# EasyEDA Pro project ProPrj_power-board_2026-10-28.epro

# Schematic Schematic1
Board Name: Board1; Create Date: 2026-01-27; Page Name: P1; Project Name: 供电板; Schematic Name: Schematic1; Update Date: 2026-02-25; BladeWidth: 10; Company: 嘉立创EDA; Page Size: A4; RegionStart: 1; ShowBorder: 1; TitleBlock: 1; TitleBlockPosition: 3; Version: V1.0; XRegionCount: 6; YRegionCount: 4
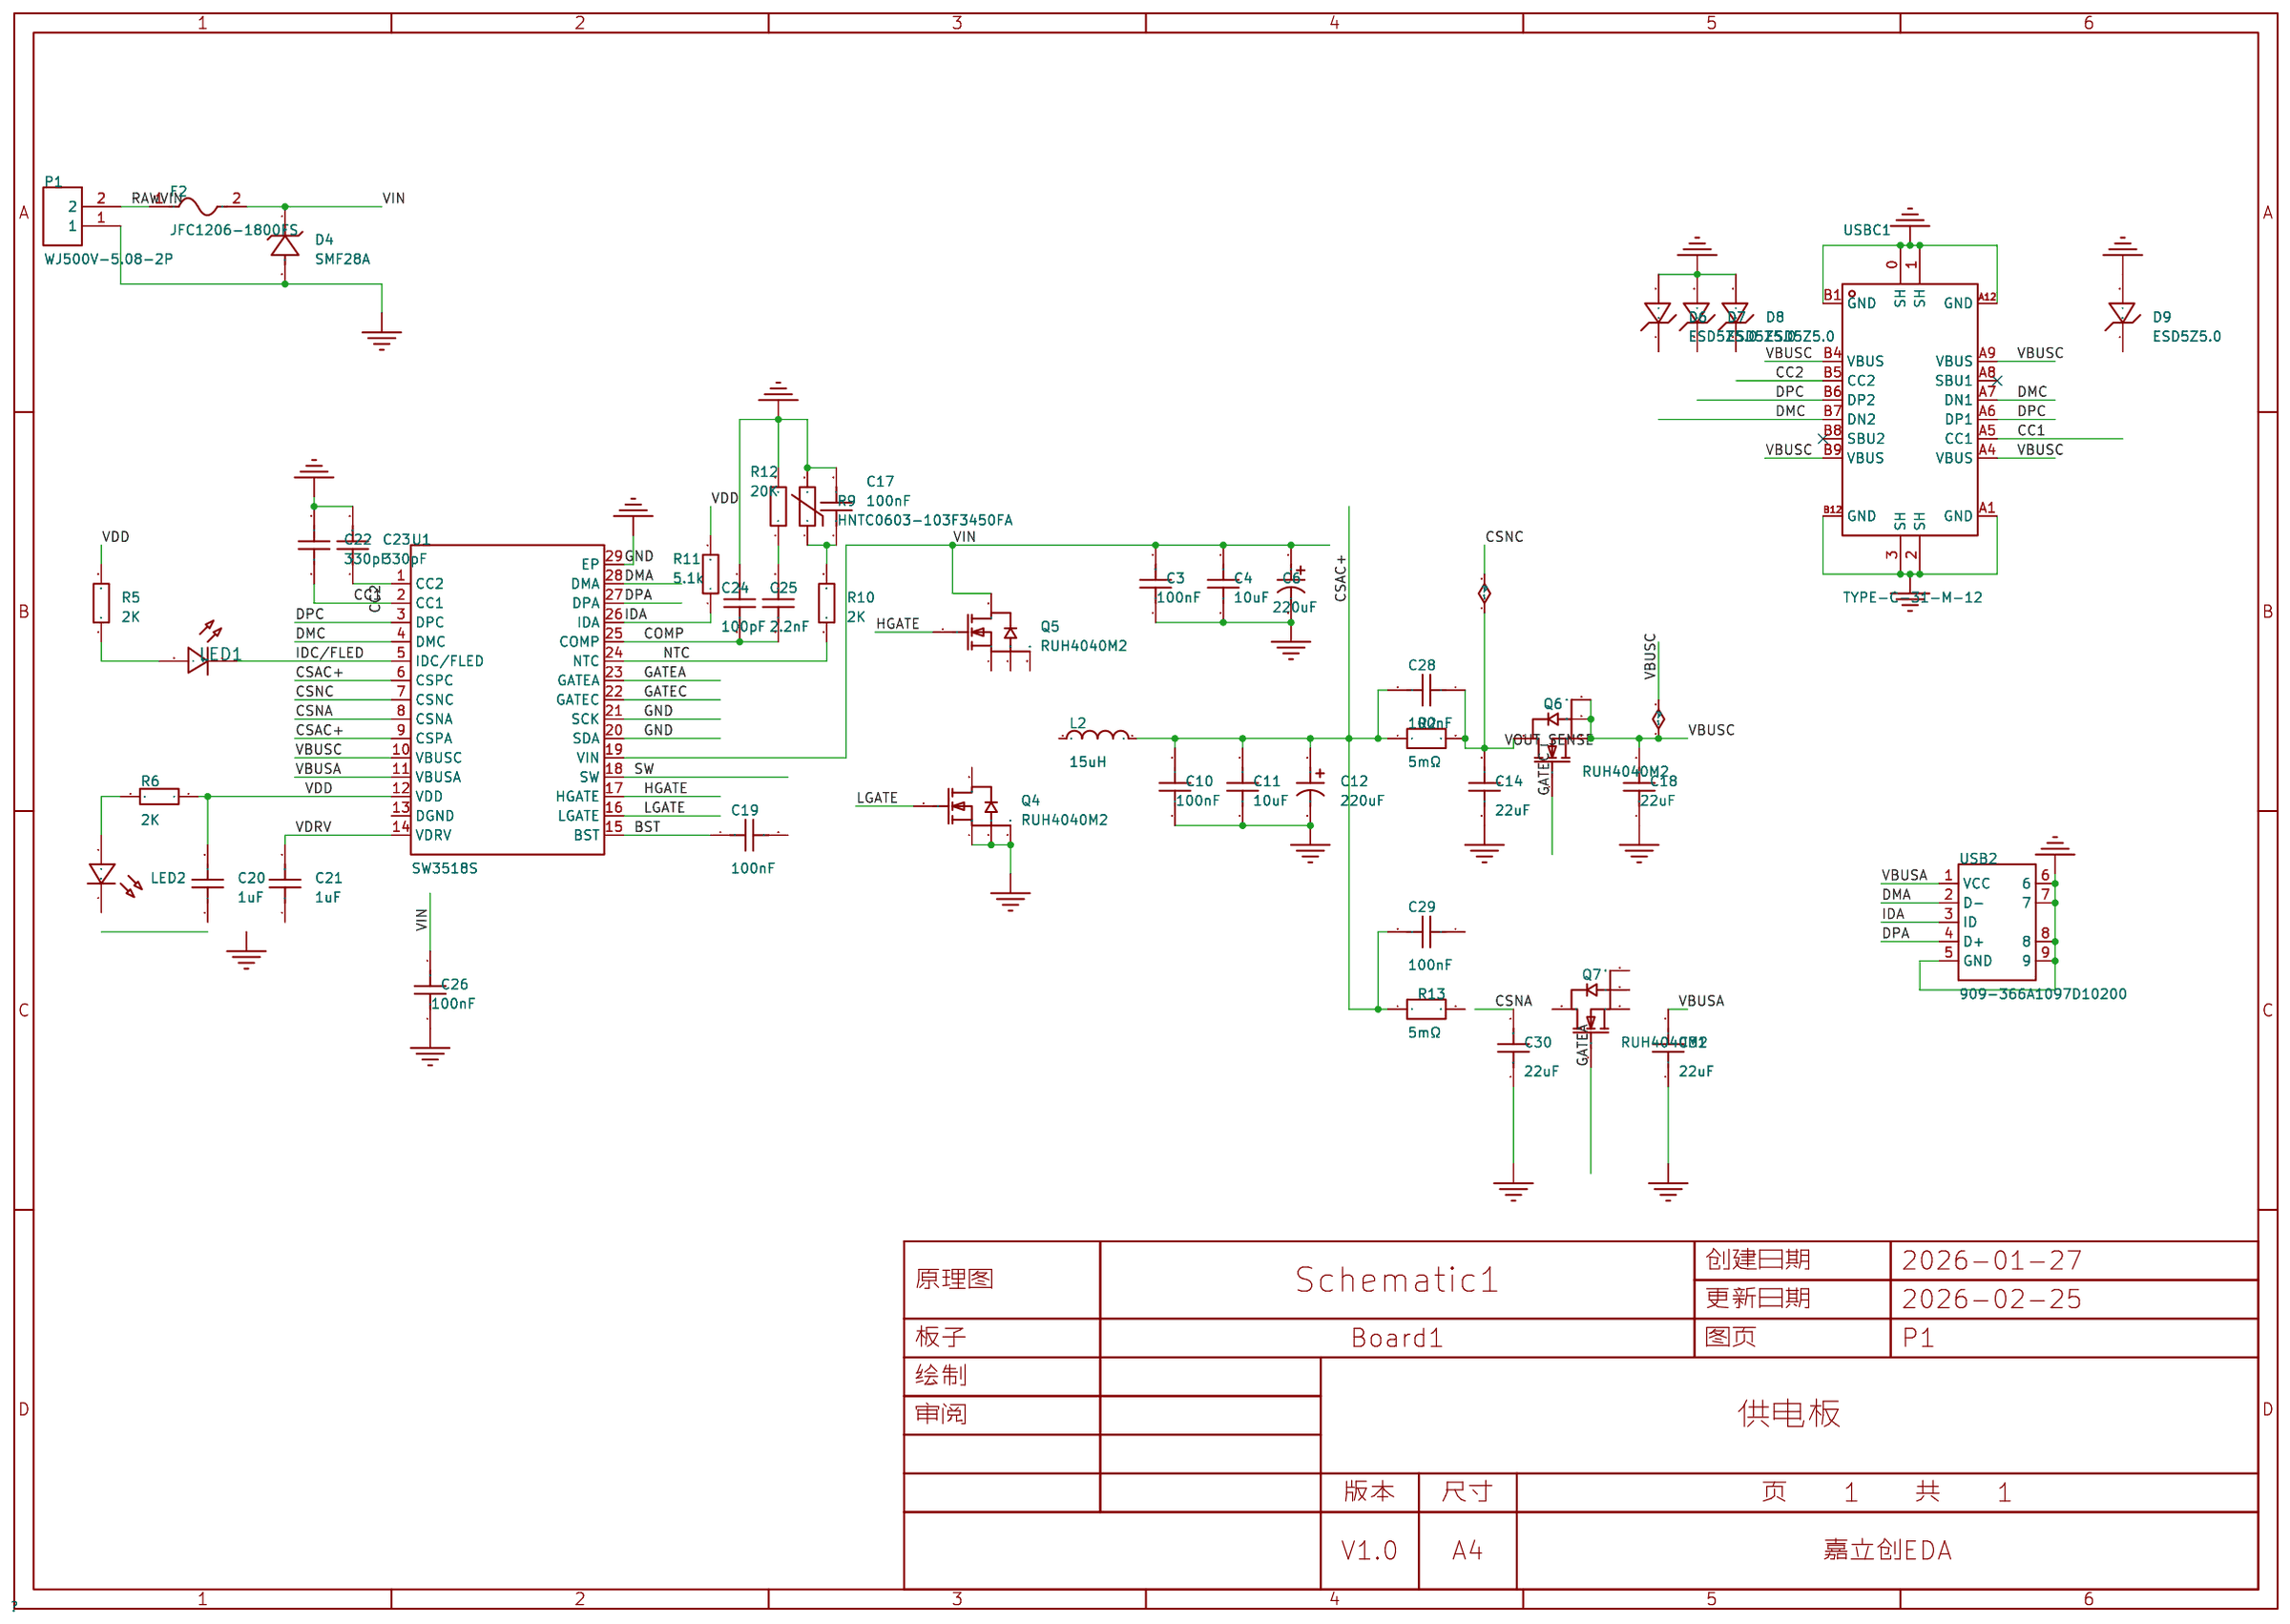
[diagram p0: schematic sheet]

## Parts
C3  100nF  [C0603]
C4  10uF  [C0603]
C6  220uF  [CAP-SMD_BD10.0-L10.3-W10.3-LS11.7-FD]
C10  100nF  [C0603]
C11  10uF  [C0603]
C12  220uF  [CAP-SMD_BD10.0-L10.3-W10.3-LS11.7-FD]
C14  22uF  [C0603]
C17  100nF  [C0603]
C18  22uF  [C0603]
C19  100nF  [C0402]
C20  1uF  [C0402]
C21  1uF  [C0402]
C22  330pF  [C0402]
C23  330pF  [C0402]
C24  100pF  [C0402]
C25  2.2nF  [C0402]
C26  100nF  [C0603]
C28  100nF  [C0603]
C29  100nF  [C0603]
C30  22uF  [C0603]
C31  22uF  [C0603]
D4  SMF28A  [SOD-123FL_L2.7-W1.8-LS3.8-RD]
D6  ESD5Z5.0  [SOD-523_L1.2-W0.8-LS1.6-RD]
D7  ESD5Z5.0  [SOD-523_L1.2-W0.8-LS1.6-RD]
D8  ESD5Z5.0  [SOD-523_L1.2-W0.8-LS1.6-RD]
D9  ESD5Z5.0  [SOD-523_L1.2-W0.8-LS1.6-RD]
F2  JFC1206-1800FS  [F1206]
L2  15uH  [IND-SMD_L12.6-W13.5]
LED1  -  [LED_0603]
LED2  -  [LED_0603]
P1  WJ500V-5.08-2P  [CONN-TH_2P-P5.00_WJ500V-5.08-2P]
Q4  RUH4040M2  [DFN-8_L3.3-W3.3-P0.65-BL-2]
Q5  RUH4040M2  [DFN-8_L3.3-W3.3-P0.65-BL-2]
Q6  RUH4040M2  [DFN-8_L3.3-W3.3-P0.65-BL-2]
Q7  RUH4040M2  [DFN-8_L3.3-W3.3-P0.65-BL-2]
R2  5mΩ  [R2512]
R5  2K  [R0603]
R6  2K  [R0603]
R9  HNTC0603-103F3450FA  [R0603]
R10  2K  [R0603]
R11  5.1k  [R0402]
R12  20K  [R0402]
R13  5mΩ  [R2512]
U1  SW3518S  [QFN-28_L4.0-W4.0-P0.40-BL-EP]
USB2  909-366A1097D10200  [USB-A-TH_C168724]
USBC1  TYPE-C-31-M-12  [USB-C_SMD-TYPE-C-31-M-12]

## Library data of the parts
C3 C4 C10 C11 C14 C17 C18 C26 C28-C31 = CAP_0603: Supplier Footprint: 0603
C6 C12 = JVJ50V220M10x10: 容值:220uF;精度:±20%;额定电压:50V;纹波电流:220mA@120Hz;; LCSC Part Name: 220uF ±20% 50V; Supplier Part: C46550417; Manufacturer: JIERR(捷而瑞); Supplier Footprint: SMD,D10xL10.5mm; JLCPCB Part Class: 扩展库; Datasheet: https://item.szlcsc.com/datasheet/JVJ50V220M10x10/48680111.html; Supplier: LCSC; Tolerance: ±20%; Voltage Rating: 50V; Ripple Current: 220mA@120Hz; Diameter: 10mm; Height - Seated (Max): 10.5mm; Lifetime: 2000hrs@105℃; Operating Temperature: -55℃~+105℃
C19-C25 = CAP_0402: Supplier Footprint: 0402
D4 = SMF28A_C720061: 反向截止电压(Vrwm):28V;钳位电压:45.4V;峰值脉冲电流(Ipp):4.4A;峰值脉冲功率(Ppp):200W;击穿电压:31.1V;; Supplier Part: C720061; Manufacturer: Littelfuse(美国力特); Supplier Footprint: SOD-123FL; JLCPCB Part Class: 扩展库; Datasheet: https://item.szlcsc.com/datasheet/SMF28A/763183.html; Supplier: LCSC; Reverse Stand-Off Voltage (Vrwm): 28V; Clamping Voltage: 45.4V; Peak Pulse Current (Ipp): 4.4A; Peak Pulse Power Dissipation (Ppp): 200W; Voltage - Breakdown: 31.1V; Reverse Leakage Current (Ir): 1uA; Type: TVS
D6-D9 = ESD5Z5.0: 极性:单向;反向截止电压(Vrwm):5V;钳位电压:18.6V;峰值脉冲电流(Ipp):9.4A;峰值脉冲功率(Ppp):200W@8/20us;击穿电压:6.2V;; LCSC Part Name: 200W单向表面贴装ESD二极管; Supplier Part: C397782; Manufacturer: AnBon(安邦); Supplier Footprint: SOD-523; JLCPCB Part Class: 扩展库; Datasheet: https://item.szlcsc.com/datasheet/ESD5Z5.0/379305.html; Supplier: LCSC; Polarity: 单向; Reverse Stand-Off Voltage (Vrwm): 5V; Clamping Voltage: 18.6V; Peak Pulse Current (Ipp): 9.4A; Peak Pulse Power Dissipation (Ppp): 200W@8/20us; Voltage - Breakdown: 6.2V; Reverse Leakage Current (Ir): 1uA; Operating Temperature: -40℃~+125℃; level of protection: IEC 61000-4-4；IEC 61000-4-5；IEC 61000-4-2; Type: ESD; Junction Capacitance: 80pF
F2 = JFC1206-1800FS: 类型:贴片式保险丝;额定电流:8A;额定电压 (AC):32V;额定电压:32V;分断能力:150A;; LCSC Part Name: 8A 32V 贴片式保险丝 快断; Supplier Part: C136353; Manufacturer: JDTfuse(集电通); Supplier Footprint: 1206; JLCPCB Part Class: 扩展库; Datasheet: https://item.szlcsc.com/datasheet/JFC1206-1800FS/147668.html; Supplier: LCSC; Type: 贴片式保险丝; Current Rating: 8A; Voltage Rating (AC): 32V; Voltage Rating (DC): 32V; Operating Temperature: -55℃~+125℃; Melting I2t: 14; Interrupt Rating: 150A; Length: 3.2mm; Width: 1.6mm
L2 = FXL1350-150-M: 电感值:15uH;精度:±20%;额定电流:8A;饱和电流(Isat):10A;类型:一体成型电感;; LCSC Part Name: 15uH ±20% 10A; Supplier Part: C7471125; Manufacturer: cjiang(长江微电); Supplier Footprint: SMD,13.5x12.6mm; JLCPCB Part Class: 扩展库; Datasheet: https://item.szlcsc.com/datasheet/FXL1350-150-M/8524279.html; Supplier: LCSC; Tolerance: ±20%; Current Rating: 8A; Current - Saturation(Isat): 10A; DC Resistance(DCR): 30mΩ; Type: 一体成型电感
LED1 = LED_0603-R: Supplier Footprint: 0603
LED2 = LED_0603-G: Supplier Footprint: 0603
P1 = WJ500V-5.08-2P: 结构:1x2P;间距:5.08mm;颜色:绿色;安装方式:直插;额定电流:18A;额定电压:250V;排数:1;线规 - AWG:14~30;线规 - 平方毫米:2.5;每排PIN数:2;触头材质:-;触头镀层:-;工作温度范围:-40℃~+105℃;焊接温度(最大值):-;; LCSC Part Name: 1x2P 5.08mm 直插 排数:1 每排P数:2; Supplier Part: C8465; Manufacturer: KANGNEX(康奈克斯电气); Supplier Footprint: 插件,P=5.08mm; JLCPCB Part Class: 扩展库; Datasheet: https://atta.szlcsc.com/upload/public/pdf/source/20191225/C8465_02D34CE5B5B4A53DF5891601D97FA9F4.pdf; Supplier: LCSC; Structure: 1x2P; Pitch: 5.08mm; Color: 绿色; Mounting Style: 直插; Current Rating (Max): 18A; Voltage Rating (Max): 250V; Number of Pins: 2P; Number of Rows: 1; Wire Gauge - AWG: 14~30; Wire Gauge - mm2: 2.5; Number of PINs Per Row: 2; Operating Temperature Range: -40℃~+105℃; Screw Specification: M2.5
Q4-Q7 = RUH4040M2_C49021258: Supplier Part: C49021258; Manufacturer: JSMSEMI(杰盛微); Supplier Footprint: DFN-8L(3x3); JLCPCB Part Class: 扩展库; Datasheet: https://item.szlcsc.com/datasheet/RUH4040M2/51379781.html; Supplier: LCSC
R2 R13 = JER2512F3R005: 电阻类型:采样电阻；合金电阻;阻值:5mΩ;精度:±1%;功率:3W;温度系数:±50ppm/℃;; LCSC Part Name: 5mΩ 3W 2512 ±1%; Supplier Part: C46634460; Manufacturer: JIERR(捷而瑞); Supplier Footprint: 2512; JLCPCB Part Class: 扩展库; Datasheet: https://item.szlcsc.com/datasheet/JER2512F3R005/48788262.html; Supplier: LCSC; Type: 采样电阻；合金电阻; Tolerance: ±1%; Power(Watts): 3W; Temperature Coefficient: ±50ppm/℃
R5 R6 R10 = Res_0603: Supplier Footprint: 0603
R9 = HNTC0603-103F3450FA: 阻值:10kΩ;电阻精度:±1%;功率:100mW;B值精度:±1%;最大稳态电流(25℃):310uA;; Supplier Part: C49247665; Manufacturer: R+O(宏嘉诚); Supplier Footprint: 0603; JLCPCB Part Class: 扩展库; Datasheet: https://item.szlcsc.com/datasheet/HNTC0603-103F3450FA/51678318.html; Supplier: LCSC; Resistance @ 25℃: 10kΩ; Resistance Tolerance: ±1%; B Constant (25℃/85℃): 3450K; Power(Watts): 100mW; B Constant Tolerance: ±1%; Steady State Current (Max): 310uA; Operating Temperature: -40℃~+125℃; Dissipation Factor: 1mW/℃; Thermal Time Constant: 5s; Length: 1.6mm; Width: 0.8mm; Height: 0.8mm; Pitch: 0.3mm
R11 R12 = Res_0402: Supplier Footprint: 0402
U1 = SW3518S: Supplier Part: C406811; Supplier Footprint: QFN-28-EP(4x4); JLCPCB Part Class: 扩展库; Supplier: LCSC
USB2 = 909-366A1097D10200: 连接器类型:Type-A;协议标准:USB 2.0;公母:母;安装方式:弯插;触点数量:5P;端口数量:1;额定电流 - 电源:1A;; LCSC Part Name: Type-A 母 弯插; Supplier Part: C168724; Manufacturer: 精拓金; Supplier Footprint: 插件; JLCPCB Part Class: 扩展库; Datasheet: https://item.szlcsc.com/datasheet/909-366A1097D10200/180107.html; Supplier: LCSC; Connector Type: Type-A; Protocol Standard: USB 2.0; Gender: 母; Mounting Type: 弯插; Number of Contacts: 5P; Number of Ports: 1; Current Rating-Power: 1A; Voltage Rating: 30V; Length: 12.9mm; Detection color: 绿色
USBC1 = TYPE-C-31-M-12: 连接器类型:Type-C;标准:-;公母:母;安装方式:-;触点数量:16P;端口数量:1;额定电流 - 电源:5A;工作温度范围:-;; LCSC Part Name: Type-C 母; Supplier Part: C165948; Manufacturer: 韩国韩荣; Supplier Footprint: SMD; JLCPCB Part Class: 扩展库; Datasheet: https://atta.szlcsc.com/upload/public/pdf/source/20220525/466408E853115E789EDB0DDC29077C05.pdf; Supplier: LCSC; Connector Type: Type-C; Gender: 母; Number of Contacts: 16P; Number of Ports: 1; Current Rating - Power (Max): 5A

## Nets
GND: C3.1 C4.1 C6.2 C10.1 C11.1 C12.2 C14.1 C17.2 C18.1 C20.1 C21.1 C22.2 C23.2 C24.2 C26.1 C30.1 C31.1 D4.2(A) D6.2(A) D7.2(A) D8.2(A) D9.2(A) LED2.1(C) P1.1 Q4.1(S) Q4.2(S) Q4.3(S) R9.2 R12.2 U1.13(DGND) U1.20(SDA) U1.21(SCK) U1.29(EP) USB2.5(GND) USB2.6 USB2.7 USB2.8 USB2.9 USBC1.0(SH) USBC1.1(SH) USBC1.2(SH) USBC1.3(SH) USBC1.A1(GND) USBC1.A12(GND) USBC1.B1(GND) USBC1.B12(GND)
VBUSA: C31.2 Q7.1(S) Q7.2(S) Q7.3(S) U1.11(VBUSA) USB2.1(VCC)
VBUSC: C18.2 Q6.1(S) Q6.2(S) Q6.3(S) U1.10(VBUSC) USBC1.A4(VBUS) USBC1.A9(VBUS) USBC1.B4(VBUS) USBC1.B9(VBUS)
VDD: C20.2 R5.2 R6.1 R11.2 U1.12(VDD)
VIN: C3.2 C4.2 C6.1 C26.2 D4.1(C) F2.2 Q5.5(D) U1.19(VIN)
BST: C19.1 U1.15(BST)
CC1: C22.1 D9.1(C) U1.2(CC1) USBC1.A5(CC1)
CC2: C23.1 D8.1(C) U1.1(CC2) USBC1.B5(CC2)
COMP: C24.1 C25.1 U1.25(COMP)
CSAC+: C10.2 C11.2 C12.1 C28.2 C29.2 L2.2 R2.1 R13.1 U1.6(CSPC) U1.9(CSPA)
CSNA: C29.1 C30.2 Q7.5(D) R13.2 U1.8(CSNA)
CSNC: C14.2 C28.1 Q6.5(D) R2.2 U1.7(CSNC)
DMA: U1.28(DMA) USB2.2(D-)
DMC: D6.1(C) U1.4(DMC) USBC1.A7(DN1) USBC1.B7(DN2)
DPA: U1.27(DPA) USB2.4(D+)
DPC: D7.1(C) U1.3(DPC) USBC1.A6(DP1) USBC1.B6(DP2)
GATEA: Q7.4(G) U1.23(GATEA)
GATEC: Q6.4(G) U1.22(GATEC)
HGATE: Q5.4(G) U1.17(HGATE)
IDA: R11.1 U1.26(IDA) USB2.3(ID)
IDC/FLED: LED1.1(C) U1.5(IDC/FLED)
LGATE: Q4.4(G) U1.16(LGATE)
NTC: R10.1 U1.24(NTC)
RAWVIN: F2.1 P1.2
SW: C19.2 L2.1 Q4.5(D) Q5.1(S) Q5.2(S) Q5.3(S) U1.18(SW)
VDRV: C21.2 U1.14(VDRV)
$1N3854: C25.2 R12.1
$1N4015: C17.1 R9.1 R10.2
Net-(LED1-2): LED1.2(A) R5.1
Net-(LED2-2): LED2.2(A) R6.2

Not connected (* = marked no-connect by the designer): USBC1 A8(SBU1)* B8(SBU2)*

# Board PCB1
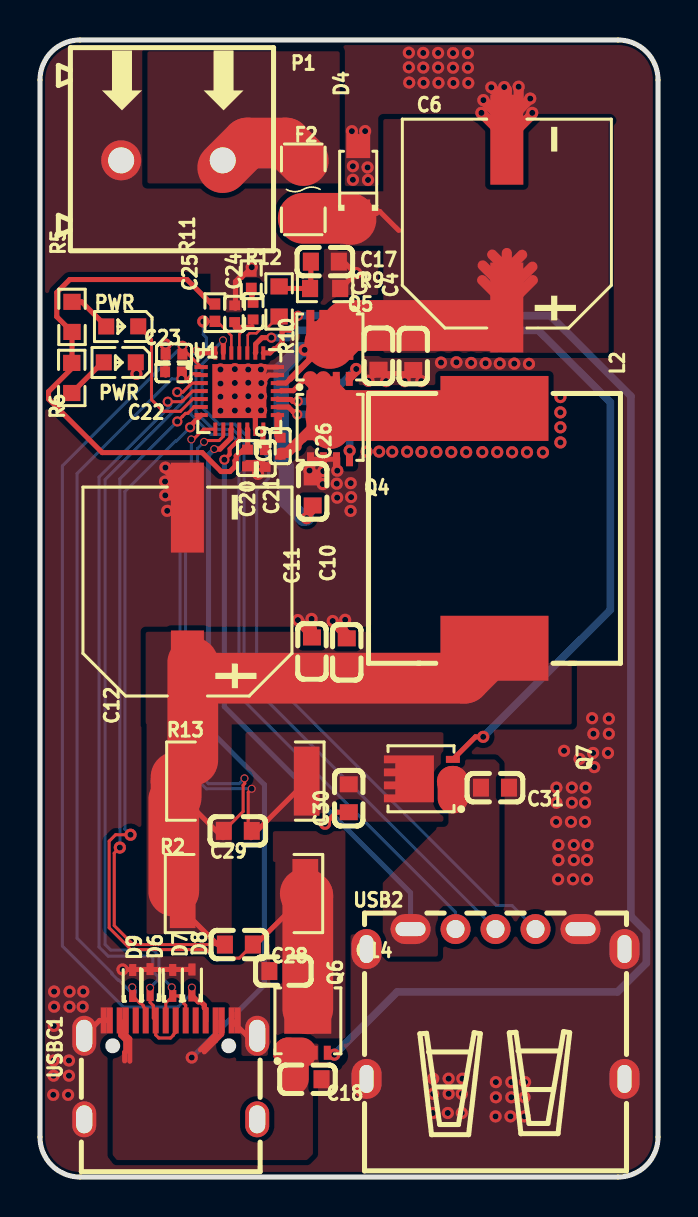
[diagram p1: board, top side]
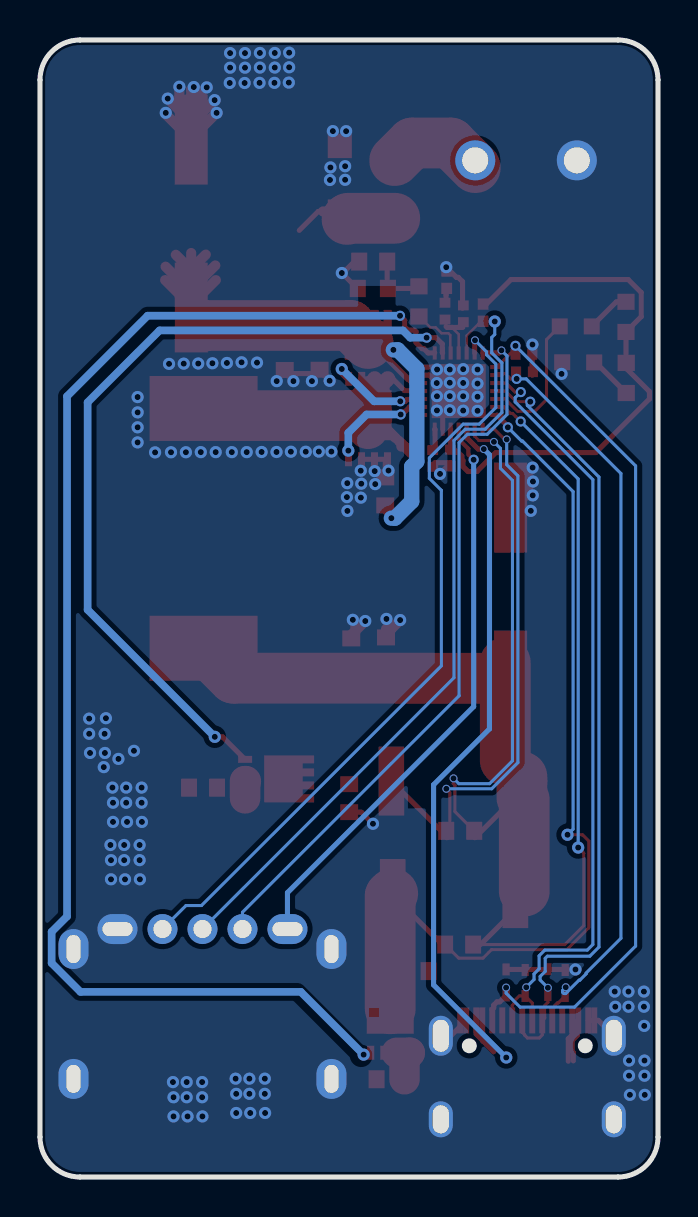
[diagram p2: board, bottom side, seen from below]

Outline 30.91 x 56.9 mm; copper layers: Top Layer, Inner1, Inner2, Bottom Layer. Coordinates in mm from the lower left corner of the outline.
Outline path: 0,54.9 0,2 arc(0.59,0.59) 2,0 28.91,0 arc(30.32,0.59) 30.91,2 30.91,54.9 arc(30.32,56.31) 28.91,56.9 2,56.9 arc(0.59,56.31) 0,54.9
Stack: Top Layer 0.035mm 外层铜厚1oz / Dielectric1 0.2104mm 7628 RC49% 8.6mil / Inner1 0.0152mm 内层铜厚 / Dielectric2 1.065mm 1.1mm H/HOZ Copper / Inner2 0.0152mm 内层铜厚 / Dielectric3 0.2104mm 7628 RC49% 8.6mil / Bottom Layer 0.035mm 外层铜厚1oz

## Design rules (mm)
net DPC: DP3
net DMC: DP3
spacing copperThickness1oz (default): track to track 0.102, other pairs 0.152 to 0.3
spacing copperThickness2oz: track to track 0.203, other pairs 0.152 to 0.3
spacing Plane_innerPlane: track to track 0.102, other pairs 0.152 to 0.3
spacing Copper_copperRegion: track to track 0.102, other pairs 0.152 to 0.3
track width copperThickness1oz (default): min 0.127, default 0.254, max 2.54
track width copperThickness2oz: min 0.203, default 0.254, max 2.54
differential pair differentialPair (default): width min 0.127, default 0.254, max 2.54; gap min 0.152, default 0.152
pour e674 uses Copper_copperRegion
pour e676 uses Copper_copperRegion
pour e678 uses Copper_copperRegion
pour e680 uses Copper_copperRegion
pour e682 uses Copper_copperRegion
pour e684 uses Copper_copperRegion
pour e686 uses Copper_copperRegion
pour e688 uses Copper_copperRegion
pour e690 uses Copper_copperRegion
pour e692 uses Copper_copperRegion
pour e694 uses Copper_copperRegion
pour e696 uses Copper_copperRegion
pour e701 uses Copper_copperRegion
pour e705 uses Copper_copperRegion

## Placement (name value [footprint] x y rotation side)
C3  100nF  [C0603]  16.93 41.1 90 top
C4  10uF  [C0603]  18.66 41.08 90 top
C6  220uF  [CAP-SMD_BD10.0-L10.3-W10.3-LS11.7-FD]  23.34 47.71 90 top
C10  100nF  [C0603]  15.34 26.25 270 top
C11  10uF  [C0603]  13.6 26.3 270 top
C12  220uF  [CAP-SMD_BD10.0-L10.3-W10.3-LS11.7-FD]  7.37 29.3 90 top
C14  22uF  [C0603]  12.17 10.31 0 top
C17  100nF  [C0603]  14.24 45.81 0 top
C18  22uF  [C0603]  13.38 4.89 180 top
C19  100nF  [C0402]  12.01 36.57 270 top
C20  1uF  [C0402]  10.38 35.98 90 top
C21  1uF  [C0402]  11.26 35.96 90 top
C22  330pF  [C0402]  6.68 40.29 180 top
C23  330pF  [C0402]  6.7 41.17 180 top
C24  100pF  [C0402]  9.73 43.2 90 top
C25  2.2nF  [C0402]  10.65 43.33 90 top
C26  100nF  [C0603]  13.64 34.31 270 top
C28  100nF  [C0603]  9.94 11.63 180 top
C29  100nF  [C0603]  9.89 17.32 180 top
C30  22uF  [C0603]  15.44 18.96 90 top
C31  22uF  [C0603]  22.75 19.48 180 top
D4  SMF28A  [SOD-123FL_L2.7-W1.8-LS3.8-RD]  15.91 49.95 90 top
D6  ESD5Z5.0  [SOD-523_L1.2-W0.8-LS1.6-RD]  5.51 9.75 90 top
D7  ESD5Z5.0  [SOD-523_L1.2-W0.8-LS1.6-RD]  6.64 9.71 90 top
D8  ESD5Z5.0  [SOD-523_L1.2-W0.8-LS1.6-RD]  7.6 9.74 90 top
D9  ESD5Z5.0  [SOD-523_L1.2-W0.8-LS1.6-RD]  4.64 9.71 90 top
F2  JFC1206-1800FS  [F1206]  13.17 49.42 270 top
L2  15uH  [IND-SMD_L12.6-W13.5]  22.73 32.46 270 top
P1  WJ500V-5.08-2P  [CONN-TH_2P-P5.00_WJ500V-5.08-2P]  6.6 50.87 0 top
PWR  -  [LED_0603]  4.06 42.56 180 top
PWR#2  -  [LED_0603]  3.94 40.76 180 top
Q4  RUH4040M2  [DFN-8_L3.3-W3.3-P0.65-BL-2]  14.5 36.68 0 top
Q5  RUH4040M2  [DFN-8_L3.3-W3.3-P0.65-BL-2]  14.49 40.7 0 top
Q6  RUH4040M2  [DFN-8_L3.3-W3.3-P0.65-BL-2]  13.39 6.98 0 top
Q7  RUH4040M2  [DFN-8_L3.3-W3.3-P0.65-BL-2]  19.88 19.92 90 top
R2  5mΩ  [R2512]  10.2 14.18 0 top
R5  2K  [R0603]  1.6 43.04 270 top
R6  2K  [R0603]  1.59 39.99 270 top
R9  HNTC0603-103F3450FA  [R0603]  14.26 44.46 0 top
R10  2K  [R0603]  11.96 43.81 90 top
R11  5.1k  [R0402]  8.75 43.25 90 top
R12  20K  [R0402]  10.57 44.9 90 top
R13  5mΩ  [R2512]  10.27 19.81 0 top
U1  SW3518S  [QFN-28_L4.0-W4.0-P0.40-BL-EP]  9.97 39.33 270 top
USB2  909-366A1097D10200  [USB-A-TH_C168724]  22.78 8.66 0 top
USBC1  TYPE-C-31-M-12  [USB-C_SMD-TYPE-C-31-M-12]  6.54 5.36 0 top

## Footprints (pads in the part's own frame, mm; a bottom-side part is the same pattern mirrored in y, then rotated)
C0402
  rect 0.5x0.54 smd: 1(-0.42,0) 2(0.42,0)
C0603
  rect 0.8x0.9 smd: 1(-0.7,0) 2(0.7,0)
CAP-SMD_BD10.0-L10.3-W10.3-LS11.7-FD
  rect 4.5x1.65 smd: 1(-4.2,0) 2(4.2,0)
CONN-TH_2P-P5.00_WJ500V-5.08-2P
  round 2 hole 1.3: 1(-2.54,0) 2(2.54,0)
DFN-8_L3.3-W3.3-P0.65-BL-2
  rect 0.35x0.7 smd: 1(-0.975,-0.765) 2(-0.325,-0.765) 3(0.325,-0.765) 4(0.975,-0.765)
  custom 2.352x2.498 smd: 5(0,0.765)
F1206
  rect 1.19x1.728 smd: 1(-1.445,0) 2(1.445,0)
IND-SMD_L12.6-W13.5
  rect 3.25x5.4 smd: 1(-6,0) 2(6,0)
LED_0603
  rect 0.8x0.8 smd: 1(-0.851,-0.01) 2(0.75,-0.005)
QFN-28_L4.0-W4.0-P0.40-BL-EP
  rect 0.2x0.665 smd: 1(-1.2,-1.907) 2(-0.8,-1.907) 3(-0.4,-1.907) 4(0,-1.907) 5(0.4,-1.907) 6(0.8,-1.907) 7(1.2,-1.907) 15(1.2,1.907) 16(0.8,1.907) 17(0.4,1.907) 18(0,1.907) 19(-0.4,1.907) 20(-0.8,1.907) 21(-1.2,1.907)
  rect 0.665x0.2 smd: 8(1.907,-1.2) 9(1.907,-0.8) 10(1.907,-0.4) 11(1.907,0) 12(1.907,0.4) 13(1.907,0.8) 14(1.907,1.2) 22(-1.907,1.2) 23(-1.907,0.8) 24(-1.907,0.4) 25(-1.907,0) 26(-1.907,-0.4) 27(-1.907,-0.8) 28(-1.907,-1.2)
  rect 2.7x2.7 smd: 29(0,0)
R0402
  rect 0.566x0.54 smd: 1(-0.433,0) 2(0.433,0)
R0603
  rect 0.806x0.864 smd: 1(-0.753,0) 2(0.753,0)
R2512
  rect 1.282x3.456 smd: 1(-3.067,0) 2(3.067,0)
SOD-123FL_L2.7-W1.8-LS3.8-RD
  rect 1.2x1.2 smd: 1(-1.635,0) 2(1.635,0)
SOD-523_L1.2-W0.8-LS1.6-RD
  rect 0.6x0.36 smd: 1(-0.65,0) 2(0.65,0)
USB-A-TH_C168724
  oval 2x1.5 hole 1.5x0.7: 1(-4.25,3.75) 5(4.25,3.75)
  round 1.5 hole 0.9: 2(-2,3.75) 3(0,3.75) 4(2,3.75)
  oval 1.5x2 hole 0.7x1.4: 6(-6.45,2.75) 7(-6.45,-3.75) 8(6.45,-3.75) 9(6.45,2.75)
USB-C_SMD-TYPE-C-31-M-12
  oval 1.2x2 hole 0.8x1.6: 0(-4.325,1.706) 1(4.325,1.706)
  oval 1.2x1.8 hole 0.8x1.4: 2(4.325,-2.474) 3(-4.325,-2.474)
  rect 0.3x1.3 smd: A1(-3.35,2.474) A4(-2.55,2.474) A5(-1.25,2.474) A6(-0.25,2.474) A7(0.25,2.474) A8(1.25,2.474) A9(2.55,2.474) A12(3.35,2.474) B1(3.05,2.474) B4(2.25,2.474) B5(1.75,2.474) B6(0.75,2.474) B7(-0.75,2.474) B8(-1.75,2.474) B9(-2.25,2.474) B12(-3.05,2.474)

## Nets
As in the schematic, except:
GND: C3.1 C4.1 C6.2 C10.1 C11.1 C12.2 C14.1 C17.2 C18.1 C20.1 C21.1 C22.2 C23.2 C24.2 C26.1 C30.1 C31.1 D4.2 D6.2 D7.2 D8.2 D9.2 P1.1 PWR#2.1 Q4.1 Q4.2 Q4.3 R9.2 R12.2 U1.13 U1.20 U1.21 U1.29 USB2.5 USB2.6 USB2.7 USB2.8 USB2.9 USBC1.0 USBC1.1 USBC1.2 USBC1.3 USBC1.A1 USBC1.A12 USBC1.B1 USBC1.B12
IDC/FLED: PWR.1 U1.5
$1N3327: PWR.2 R5.1
$1N3513: PWR#2.2 R6.2

Pads without a net: USBC1 A8 B8

## Via types
v1: diameter 0.61, hole 0.305, Top Layer to Bottom Layer, 164 vias
v2: diameter 0.399, hole 0.299, Top Layer to Bottom Layer, 11 vias
v3: diameter 0.508, hole 0.305, Top Layer to Bottom Layer, 11 vias

## Routing (per net, layer and track width the routed paths; a pad name or vN(x,y) marks a point on that pad's centre or on a via; arc(x,y) is an arc through that point)
GND: length 45.2
  Top Layer w0.254: D8.2 v1(4.13,10.39) ; 11.15,35.75 11.15,35.74 10.36,35.74 10.9,35.2 v1(10.9,35.18) ; v1(13.58,27.93) 13.6,27.91 C11.1 ; v1(19.07,39.83) 19.07,39.98 C4.1 18.66,40.29 ; v1(10.59,45.53) 10.08,45.02 9.98,45.02 9.77,44.81 9.77,43.47 ; v1(11.05,38.36) 10.77,38.07 U1.13 ; 15.26,27.2 v1(15.26,27.88) ; 2.21,7.07 2.98,7.84 USBC1.A1 USBC1.B12 ; U1.20 11.45,40.13 11.26,39.94 11.26,39.93 v1(11.06,39.73) ; USBC1.B1 10.35,7.07 USBC1.1 ; C26.1 13.64,35.81 Q4.1 Q4.2 Q4.3 ; 11.88,40.53 11.17,40.53 v1(11.05,40.41) ; 6.28,40.13 6.29,40.14 6.29,41.16 ; 14.94,46.05 15.76,45.24 v1(15.81,45.24) 15.04,44.46 R9.2 ; 18.66,40.29 18.57,40.2 17.12,40.2 17.31,40.02 v1(17.31,39.83) ; 18.66,40.29 18.66,40.26 v1(18.23,39.83) ; C30.1 14.83,18.26 v1(14.25,17.68) ; v1(16.42,39.84) 16.93,40.35 C3.1 ; 9.17,38.2 v1(9.03,38.34) ; v1(15.6,52.33) 15.91,52.02 D4.2 16.26,51.94 v1(16.26,52.34)
  Top Layer w0.508: v1(6.36,33.34) 7.22,33.34 7.64,33.75 7.64,34.13 v1(6.27,35.5) ; v1(22.17,53.89) 23.34,52.72 ; C6.2 24.62,53.18 v1(24.62,53.25) ; 13.6,27.42 13.34,27.42 v1(12.9,27.87) ; v1(22.57,54.53) 23.34,53.75 23.34,54.41 v1(23.22,54.54) ; v1(6.25,34.8) 6.95,34.11 v1(6.26,34.11) ; C10.1 15.34,27.12 15.26,27.2 v1(14.64,27.82) ; v1(23.94,54.56) 23.94,53.38 v1(24.52,53.96) ; v1(22.07,53.25) 23.34,51.98
  vias: v1(0.7,9.28) v1(0.7,8.52) v1(0.69,7.56) v1(0.68,5.83) v1(0.68,5.07) v1(0.66,4.11) v1(1.41,4.11) v1(1.48,9.28) v1(1.48,8.52) v1(1.45,5.83) v1(1.45,5.07) v1(2.14,8.52) v1(2.16,9.28) v1(4.82,40.19) v1(6.28,41.66) v1(9.03,40.41) v1(9.03,39.7) v1(9.03,39.04) v1(9.74,40.43) v1(9.74,39.73) v1(9.74,39.07) v1(9.74,38.35) v1(10.41,40.41) v1(10.41,39.75) v1(10.41,39.07) v1(10.41,38.37) v1(11.05,39.07) v1(13.48,35.35) v1(14.17,35.32) v1(14.14,34.67) v1(14.87,35.34) v1(14.84,34.69) v1(14.86,34) v1(15.53,33.33) v1(15.54,34.72) v1(15.56,34.02) v1(15.65,50.58) v1(15.65,49.9) v1(16.33,36.3) v1(16.38,50.52) v1(16.4,49.89) v1(16.96,36.3) v1(17.61,36.29) v1(18.36,36.29) v1(18.45,56.26) v1(18.45,55.53) v1(18.46,54.77) v1(19.08,36.28) v1(19.16,56.25) v1(19.16,55.52) v1(19.18,54.75) v1(19.66,4.92) v1(19.66,4.16) v1(19.65,3.2) v1(19.82,36.28) v1(19.91,56.25) v1(19.91,55.52) v1(19.93,54.75) v1(20.05,40.75) v1(20.44,4.92) v1(20.44,4.16) v1(20.39,3.2) v1(20.57,36.27) v1(20.65,56.24) v1(20.65,55.51) v1(20.67,54.75) v1(20.82,40.77) v1(21.12,4.92) v1(21.09,4.16) v1(21.09,3.2) v1(21.31,36.27) v1(21.4,56.24) v1(21.4,55.51) v1(21.42,54.75) v1(21.56,40.74) v1(22.12,36.27) v1(22.28,40.72) v1(22.8,4.75) v1(22.8,3.99) v1(22.78,3.03) v1(22.86,36.27) v1(22.99,40.71) v1(23.53,3.03) v1(23.61,36.27) v1(23.57,4.75) v1(23.57,3.99) v1(23.72,40.7) v1(24.23,3.99) v1(24.23,3.03) v1(24.26,4.75) v1(24.35,36.27) v1(24.45,40.69) v1(25.15,36.26) v1(25.82,19.49) v1(25.82,18.73) v1(25.81,17.77) v1(25.92,16.61) v1(25.92,15.86) v1(25.91,14.9) v1(26.02,39.03) v1(26.02,38.26) v1(26.02,37.52) v1(26.02,36.76) v1(26.21,21.33) v1(26.6,19.49) v1(26.6,18.73) v1(26.55,17.77) v1(26.7,16.61) v1(26.7,15.86) v1(26.65,14.9) v1(26.98,20.92) v1(27.28,19.49) v1(27.25,18.73) v1(27.25,17.77) v1(27.38,16.61) v1(27.35,15.86) v1(27.35,14.9) v1(27.61,22.96) v1(27.67,22.18) v1(27.66,21.22) v1(27.72,20.51) v1(28.4,21.22) v1(28.45,22.94) v1(28.45,22.18)
VBUSA: length 30.1
  Top Layer w0.203: U1.11 9.97,36.93 9.48,36.44 9.48,36.16 v3(9.22,35.89)
  Top Layer w1.524: Q7.1 Q7.2 20.65,19.81 20.61,19.81
  Bottom Layer w0.254: v3(9.22,35.89) 9.22,23.54 18.53,14.23 USB2.1
VBUSC: length 44.8
  Top Layer w0.254: USBC1.B9 4.29,7.12 4.49,6.92 4.49,5.8 ; USBC1.B4 8.79,7.13 8.02,6.37 ; USBC1.A9 9.09,7.14 8.78,6.84 8.78,6.83 8.22,6.26 ; USBC1.A4 4.04,7.79 4.04,7.09 4.29,6.84 4.29,6.3 4.23,6.24 4.23,5.81 ; v2(8.71,36.43) 9,36.43 9.55,36.97 9.55,37.4 U1.10
  Top Layer w1.524: C18.2 12.68,5.96 Q6.1 Q6.2
  Bottom Layer w0.254: v1(7.59,5.98) 11.22,9.61 11.22,19.63 8.43,22.42 8.43,36.14 v2(8.71,36.43)
VDD: length 27.9
  Top Layer w0.254: R11.2 8.58,43.68 7.35,44.91 1.49,44.91 0.84,44.26 0.84,43.05 R5.2 1.6,40.75 R6.1 1.59,40.46 0.43,39.3 0.43,38.94 3.11,36.25 8.11,36.25 9.06,35.3 9.5,35.3 9.75,35.56 9.75,35.84 9.81,35.9 9.81,36.09 9.98,36.25 10.03,36.25 10.39,36.61 10.39,37.4 U1.12
VIN: length 38.7
  Top Layer w0.254: 13.87,33.37 C26.2 13.64,33.27 v1(13.34,32.97) ; 16.16,48.32 16.99,48.32 17.94,47.37 ; 11.88,39.73 12.3,39.73 12.51,39.94 ; 14.04,41.47 Q5.5
  Top Layer w0.305: 12.51,39.94 14.04,41.47
  Top Layer w0.508: 24.11,46.15 23.37,45.41 ; C6.1 23.34,43.65 22.11,44.88 ; 22.14,45.61 23.34,44.41 23.34,45.43 ; 23.34,45.43 23.34,46.24 ; 23.34,45.43 22.61,46.16 ; 15.93,48.32 16.75,48.32 ; 24.62,45.55 23.37,44.3 ; 24.65,44.88 23.72,43.95
  Top Layer w2.54: 14.49,41.71 15.39,42.61 22.7,42.61 22.74,42.57 ; F2.2 15.49,47.97 ; 15.53,47.94 15.55,47.92
  Bottom Layer w0.762: v1(13.23,41.39) 13.01,41.39 12.06,40.44 12.06,35.81 12.32,35.55 12.32,33.81 13.15,32.97 v1(13.34,32.97)
BST: length 1.1
  Top Layer w0.254: 11.93,38.07 U1.15
  Top Layer w0.381: 11.93,37.1 11.91,37.12 11.91,38.06 11.93,38.07
CC1: length 37.9
  Top Layer w0.152: D9.1 4.98,8.71 5.03,8.71 5.17,8.58 5.17,8.53 5.29,8.41 USBC1.A5 ; U1.2 7.99,40.2 7.63,40.2 7.37,39.94 v3(7.07,39.94)
  Top Layer w0.254: v3(7.07,39.94) 7.1,39.97 C22.1
  Bottom Layer w0.152: v2(4.61,9.5) 4.77,9.34 4.77,9.25 4.71,9.18 4.62,9.18 3.95,9.85 3.91,9.85 3.59,10.16 3.59,10.21 1.85,11.94 1.85,35.2 6.59,39.94 v3(7.07,39.94)
CC2: length 44.1
  Top Layer w0.152: 7.13,41.46 8.06,40.53
  Top Layer w0.254: USBC1.B5 8.29,8.4 8.22,8.47 8.22,8.6 8.05,8.77 7.92,8.77 D8.1 ; 7.13,41.16 7.13,41.16 7.13,41.46
  Bottom Layer w0.152: v2(7.6,9.48) 7.6,9.2 6.9,8.5 4.17,8.5 1.12,11.56 1.12,35.59 v3(7.13,41.59)
COMP: length 2.3
  Top Layer w0.127: 10.31,42.51 9.97,42.17 U1.25
  Top Layer w0.254: 10.6,42.56 10.55,42.51 9.76,42.51
CSAC+: length 89.7
  Top Layer w0.152: C29.2 10.16,18.29 10.16,19.61 10.24,19.69 10.24,19.94 v2(10.23,19.95) ; v2(8.2,36.79) 8.27,36.85 8.96,36.85 9.17,37.06 U1.9 ; 8.06,38.53 7.99,38.53 arc(8.1,38.53) 8.21,38.51 8.21,38.55 7.73,38.55 arc(7.71,38.55) 7.69,38.55 7.69,38.52 7.39,38.21 7.28,38.21 7.13,38.06 7.12,38.06 v3(6.87,37.81) ; C28.2 4.66,11.63 3.71,12.58 3.71,16.21 v1(3.99,16.49)
  Top Layer w0.254: 9.15,16.98 7.2,18.93 ; 8.87,11.63 7.13,13.37
  Top Layer w2.54: 6.81,18.99 6.81,20.02 ; 8.16,24.96 21.23,24.96 L2.2 ; 6.69,18.87 6.69,14.31 ; 7.64,25.74 7.64,20.85
  Bottom Layer w0.152: v1(3.99,16.49) 3.99,34.93 v3(6.87,37.81) ; v2(8.2,36.79) 7.88,36.46 7.88,35.46 7.28,34.86 7.28,20.83 8.42,19.68 9.96,19.68 v2(10.23,19.95)
CSNA: length 28.2
  Top Layer w0.152: v2(7.57,36.91) 7.67,36.91 8.18,37.42 U1.8 ; C29.1 10.41,17.5 10.41,19.25 v2(10.59,19.43)
  Top Layer w0.254: R13.2 10.55,17.03 10.55,16.98
  Bottom Layer w0.152: v2(10.59,19.43) 8.32,19.43 7.01,20.74 7.01,35.09 7.57,35.65 v2(7.57,36.91)
CSNC: length 45.8
  Top Layer w0.152: v1(4.53,17.13) 3.78,17.13 3.46,16.81 3.46,12.47 4.55,11.38 8.33,11.38 8.75,10.95 9.97,10.95 C28.1
  Top Layer w0.254: 10.72,11.56 13.27,14.11 ; U1.7 7.51,37.58 v3(7.51,37.52)
  Top Layer w2.54: R2.2 13.39,14.06 13.39,8.42
  Bottom Layer w0.152: v1(4.53,17.13) 4.25,17.41 4.25,34.3 6.77,36.83 6.82,36.83 v3(7.51,37.52)
DMA: length 36.1
  Top Layer w0.254: U1.28 7.96,41.24 v2(7.83,41.36)
  Bottom Layer w0.152: USB2.2 20.78,13.25 9.95,24.08 9.95,36.75 9.53,37.17 8.54,37.17 7.55,38.15 7.55,41.09 v2(7.83,41.36)
DMC: length 39.3
  Top Layer w0.152: USBC1.A7 6.79,7.24 6.67,7.12 6.67,7.09 6.53,6.96 5.94,6.96 5.79,7.11 USBC1.B7 5.67,7.96 5.67,8.58 5.51,8.74 D6.1 ; v3(6.39,38.8) 7.08,38.8 7.13,38.85 7.15,38.85 7.63,39.33 U1.4
  Bottom Layer w0.152: v2(5.51,9.47) 5.89,9.86 5.89,10.03 5.64,10.29 5.64,10.94 5.53,11.05 3.41,11.05 2.95,11.51 2.95,35.03 6.53,38.61 6.53,38.65 v3(6.39,38.8)
DPA: length 38.9
  Top Layer w0.254: U1.27 9.17,41.86 v2(9.15,41.87)
  Bottom Layer w0.152: USB2.4 23.6,13.59 22.83,13.59 10.83,25.58 10.83,34.36 11.44,34.96 11.44,35.98 9.74,37.67 8.94,37.67 8.11,38.5 8.11,39.38 ; 8.11,39.38 8.11,40.68 8.57,41.14 8.57,41.29 v2(9.15,41.87) ; 8.11,39.38 8.09,39.36
DPC: length 38.6
  Top Layer w0.152: 8.06,39.73 7.6,39.73 7.15,39.28 v3(6.86,39.28) ; USBC1.A6 6.29,8.71 D7.1 6.94,9.06 7.19,8.81 7.19,8.69 7.29,8.59 USBC1.B6
  Bottom Layer w0.152: v2(6.59,9.49) 6.2,9.88 6.2,10.16 5.95,10.42 5.95,11.07 5.66,11.36 3.54,11.36 3.26,11.63 3.26,34.9 7.14,38.78 7.14,39 v3(6.86,39.28)
GATEA: length 41.3
  Top Layer w0.254: v1(22.16,22.03) 21.78,22.03 Q7.4 ; v3(11.57,42) 11.1,42 10.79,41.68 10.79,41.26 U1.23
  Bottom Layer w0.381: v1(22.16,22.03) 28.52,28.39 28.52,38.76 24.92,42.36 12.75,42.36 12.39,42 v3(11.57,42)
GATEC: length 67.5
  Top Layer w0.254: v3(12.9,43.1) 12.67,42.86 12.67,42.54 12.5,42.38 12.18,42.38 12.1,42.3 12.1,41.76 11.79,41.45 11.71,41.45 11.5,41.24 U1.22
  Bottom Layer w0.381: v3(12.9,43.1) 12.9,43.1 25.52,43.1 29.55,39.07 29.55,13.04 30.32,12.27 30.32,10.71 28.88,9.26 17.86,9.26 v1(14.72,6.12)
HGATE: length 5.3
  Top Layer w0.254: U1.17 11.9,38.91 12.55,38.91 12.64,38.82 v3(12.89,38.82)
  Top Layer w0.381: v1(15.81,40.43) 15.81,40.29 Q5.4
  Bottom Layer w0.381: v3(12.89,38.82) 14.2,38.82 v1(15.81,40.43)
IDA: length 40
  Top Layer w0.127: 8.75,42.82 8.89,42.68 8.99,42.68 9.57,42.1 U1.26
  Top Layer w0.152: v1(8.16,42.81) 8.74,42.81 8.75,42.82
  Bottom Layer w0.152: v1(8.16,42.81) 8.16,42.16 8.32,42.01 8.32,41.25 7.81,40.74 7.81,38.26 8.65,37.42 9.64,37.42 10.2,36.86 10.2,24.99 USB2.3
IDC/FLED: length 6.9
  Top Layer w0.152: PWR.1 5.58,41.91 5.58,38.9 6.16,38.31 7.02,38.31 7.65,38.95 8.04,38.95 U1.5
LGATE: length 5.2
  Top Layer w0.254: 11.88,38.53 12.43,38.53 12.67,38.28 12.74,38.28 v3(12.87,38.16)
  Bottom Layer w0.254: 12.89,38.28 12.89,38.18 v3(12.87,38.16)
  Bottom Layer w0.381: v1(15.49,36.35) 15.49,37.24 14.57,38.16 12.89,38.16
NTC: length 2.9
  Top Layer w0.127: 11.96,43.06 11.94,43.06 11.39,42.51 11.12,42.51 10.82,42.22 10.48,42.22 10.39,42.13 10.39,41.49 10.37,41.47 U1.24
RAWVIN: length 4.9
  Top Layer w2.54: F2.1 12.29,51.74 10.37,51.74 9.14,50.51
SW: length 15.6
  Top Layer w0.254: Q5.3 14.31,39.94 ; 12.06,39.34 12.07,39.35 12.67,39.35 13.26,39.94 Q5.1
  Top Layer w0.381: Q5.3 14.82,39.37
  Top Layer w0.508: 12.68,36.55 12.37,36.25 12.04,36.25 ; 12.68,36.55 12.96,36.84 ; 12.68,36.55 12.83,36.55 ; 13.12,36.97 13.59,37.45 ; 12.01,36.21 C19.2 12.03,36.17 12.03,36.23 12.01,36.21
  Top Layer w0.762: 13.81,39.02 13.81,39.65 Q5.1 ; Q5.2 14.19,39.92
  Top Layer w2.032: 14.34,38.89 14.31,38.92 ; Q4.5 14.5,38.73
  Top Layer w2.54: L2.1 22.37,38.1 14.54,38.1
VDRV: length 0.8
  Top Layer w0.254: U1.14 11.15,37.4 11.15,36.59
$1N3327: length 2.2
  Top Layer w0.254: 3.31,42.56 2.08,43.79 R5.1
$1N3513: length 2.2
  Top Layer w0.254: PWR#2.2 3.12,40.76 R6.2
$1N3854: length 0.5
  Top Layer w0.254: 10.64,43.7 10.6,43.74 10.6,44.14 10.59,44.15
$1N4015: length 3.2
  Top Layer w0.254: 13.54,46.05 13.54,44.5 R9.1 12.06,44.46 R10.2

## Copper pours and planes (outline as drawn; the poured copper is in the pictures)
GND on Top Layer: -2.82,59.35 34.13,59.35 34.13,-2.82 -2.82,-2.82
GND on Bottom Layer: 16.15,40.39 26.28,40.39 26.28,36.04 16.15,36.04
GND on Bottom Layer: -0.15,57.21 31,57.21 31,-0.54 -0.15,-0.54
GND on Inner1: -3.46,60.8 34.8,60.8 34.8,-1.3 -3.46,-1.3
GND on Inner2: -3.33,61.12 39.35,61.12 39.35,-5.03 -3.33,-5.03
VBUSA on Top Layer: 17.14,11.37 17.48,11.03 19.9,11.03 19.9,13.3 20.16,13.55 22.95,13.55 22.98,13.59 22.98,20.66 22.75,20.89 20.59,20.89 19.81,20.11 19.81,17.4 17.14,14.73
VBUSC on Top Layer: 12.08,6.64 12.08,5.8 9.81,5.8 9.81,6.98 9.3,7.13 3.64,7.13 3.64,1.11 3.84,0.85 13.35,0.85 13.65,1.15 13.65,5.31 13.38,5.58 13.4,5.6 14.87,5.6 14.87,6.81 12.25,6.81
VIN on Top Layer: 14.99,49.33 20.55,49.33 20.55,46.6 14.99,46.6
VIN on Top Layer: 17.17,52.94 17.17,41.24 28.44,41.24 28.44,52.74 28.57,52.87 28.5,52.94
CSAC+ on Top Layer: 5.29,27.28 26.59,27.28 26.59,22.64 5.29,22.64
CSAC+ on Top Layer: 5.33,27.22 9.58,27.22 9.58,12.15 5.33,12.15
CSNA on Top Layer: 10.27,22.26 20.17,22.26 20.17,17.78 10.27,17.78
CSNC on Top Layer: 15.14,17.4 15.04,17.31 11.65,17.31 11.65,15.76 11.77,15.76 11.77,6.93 15.27,6.93 15.27,17.26
RAWVIN on Top Layer: 5.37,56.33 14.99,56.33 14.99,49.72 5.37,49.72
